# Altium schematic sheet AT-kdFCU.SchDoc
size A4; SheetNumber: 1; SheetTotal: 3
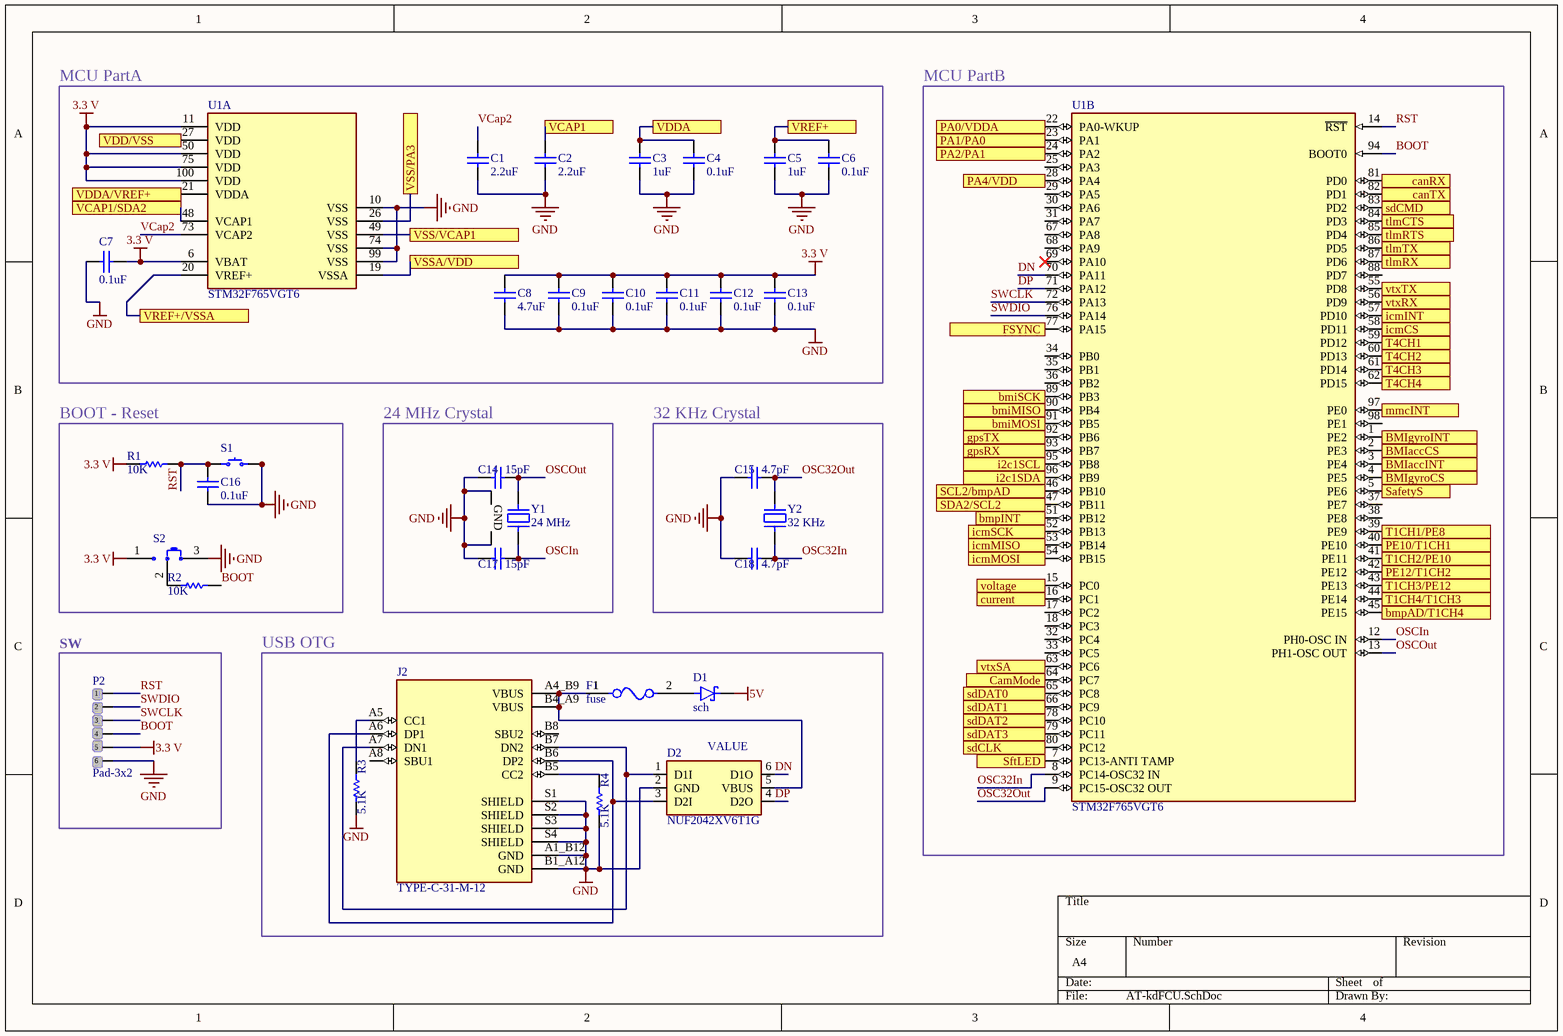
[diagram p0: AT-kdFCU.SchDoc]

## Parts
C1  2.2uF  [Capacitor-0603]
C2  2.2uF  [Capacitor-0603]
C3  1uF  [Capacitor-0603]
C4  0.1uF  [Capacitor-0603]
C5  1uF  [Capacitor-0603]
C6  0.1uF  [Capacitor-0603]
C7  0.1uF  [Capacitor-0603]
C8  4.7uF  [Capacitor-0603]
C9  0.1uF  [Capacitor-0603]
C10  0.1uF  [Capacitor-0603]
C11  0.1uF  [Capacitor-0603]
C12  0.1uF  [Capacitor-0603]
C13  0.1uF  [Capacitor-0603]
C14  15pF  [Capacitor-0603]
C15  4.7pF  [Capacitor-0603]
C16  0.1uF  [Capacitor-0603]
C17  15pF  [Capacitor-0603]
C18  4.7pF  [Capacitor-0603]
D1  sch  [SODFL3619X98N]
D2  NUF2042XV6T1G  [SOT-563]
F1  fuse  [FP-MF-NSMF012-2-MFG]
J2  TYPE-C-31-M-12  [HRO_TYPE-C-31-M-12]
P2  Pad-3x2  [Pad-3x2]
R1  10K  [Resistor-0603]
R2  10K  [Resistor-0603]
R3  5.1K  [Resistor-0603]
R4  5.1K  [Resistor-0603]
S1  PTS810 SJM 250 SMTR LFS  [button]  (value not drawn)
S2  slideSwitch  [switch]  (value not drawn)
U1  STM32F765VGT6  [FP-LQFP100-1L-IPC_B]  (parts A,B of 2)
Y1  24 MHz  [XTAL_TSX-3225_25.0000MF10P-C3]
Y2  32 KHz  [XTAL_ABS07-32.768KHZ-7-T]

## Blocks framed on the sheet
MCU PartA: C1-C13 U1
MCU PartB: U1
BOOT - Reset: C16 R1 R2 S1 S2
24 MHz Crystal: C14 C17 Y1
32 KHz Crystal: C15 C18 Y2
SW: P2
USB OTG: D1 D2 F1 J2 R3 R4

## Ports
BMIaccCS (see AT-kdSENS[1A]), BMIaccINT (see AT-kdSENS[1A]), BMIgyroCS (see AT-kdSENS[1A]), BMIgyroINT (see AT-kdSENS[1A]), bmiMISO (see AT-kdSENS[2B]), bmiMOSI (see AT-kdSENS[1A]), bmiSCK (see AT-kdSENS[1A]), bmpAD/T1CH4 (see AT-kdCONN[2D]), bmpINT (see AT-kdSENS[4A]), CamMode (see AT-kdCONN[2C]), canRX (see AT-kdSENS[1C]), canTX (see AT-kdSENS[1B]), current (see AT-kdCONN[3A]), FSYNC (see AT-kdSENS[1A], AT-kdSENS[2A]), gpsRX (see AT-kdCONN[3C]), gpsTX (see AT-kdCONN[3C]), i2c1SCL (see AT-kdSENS[2C]), i2c1SDA (see AT-kdSENS[2D]), icmCS (see AT-kdSENS[2A]), icmINT (see AT-kdSENS[3A]), icmMISO (see AT-kdSENS[2A]), icmMOSI (see AT-kdSENS[2A]), icmSCK (see AT-kdSENS[2A]), mmcINT (see AT-kdSENS[3C]), PA0/VDDA (see AT-kdCONN[2C]), PA1/PA0 (see AT-kdCONN[2C]), PA2/PA1 (see AT-kdCONN[2C]), PA4/VDD (see AT-kdCONN[2C]), PE10/T1CH1 (see AT-kdCONN[2C]), PE12/T1CH2 (see AT-kdCONN[2D]), SafetyS (see AT-kdSENS[4B]), SCL2/bmpAD (see AT-kdCONN[2D]), SDA2/SCL2 (see AT-kdCONN[2D]), sdCLK (see AT-kdSENS[1D]), sdCMD (see AT-kdSENS[1D]), sdDAT0 (see AT-kdSENS[1D]), sdDAT1 (see AT-kdSENS[1D]), sdDAT2 (see AT-kdSENS[1D]), sdDAT3 (see AT-kdSENS[1D]), SftLED (see AT-kdSENS[4C]), T1CH1/PE8 (see AT-kdCONN[2C]), T1CH2/PE10 (see AT-kdCONN[2C]), T1CH3/PE12 (see AT-kdCONN[2D]), T1CH4/T1CH3 (see AT-kdCONN[2D]), T4CH1 (see AT-kdCONN[1A]), T4CH2 (see AT-kdCONN[1A]), T4CH3 (see AT-kdCONN[1A]), T4CH4 (see AT-kdCONN[1A]), tlmCTS (see AT-kdCONN[3C]), tlmRTS (see AT-kdCONN[3C]), tlmRX (see AT-kdCONN[3C]), tlmTX (see AT-kdCONN[3C]), VCAP1 (see AT-kdCONN[1D]), VCAP1/SDA2 (see AT-kdCONN[2D]), VDD/VSS (see AT-kdCONN[2C]), VDDA (see AT-kdCONN[1C]), VDDA/VREF+ (see AT-kdCONN[2B]), voltage (see AT-kdCONN[3A]), VREF+ (see AT-kdCONN[1C]), VREF+/VSSA (see AT-kdCONN[2B]), VSS/PA3 (see AT-kdCONN[2C]), VSS/VCAP1 (see AT-kdCONN[2D]), VSSA/VDD (see AT-kdCONN[2B]), vtxRX (see AT-kdCONN[4C]), vtxSA (see AT-kdCONN[4C]), vtxTX (see AT-kdCONN[4C])

## Nets
3.3 V: C7.2 C8.2 C9.2 C10.2 C11.2 C12.2 C13.2 P2.5 R1.1 S2.1 U1.6(VBAT) U1.11(VDD) U1.50(VDD) U1.75(VDD) U1.100(VDD)
5V: D1.K
GND: C1.1 C2.1 C3.1 C4.1 C5.1 C6.1 C7.1 C8.1 C9.1 C10.1 C11.1 C12.1 C13.1 C14.2 C15.2 C16.1 C17.2 C18.2 D2.2(GND) J2.A1_B12(GND) J2.B1_A12(GND) J2.S1(SHIELD) J2.S2(SHIELD) J2.S3(SHIELD) J2.S4(SHIELD) P2.6 R3.1 R4.1 S1.3 S1.4 S2.3 U1.10(VSS) U1.74(VSS) U1.99(VSS) Y1.2(GND) Y1.4(GND)
BMIaccCS: U1.2(PE3) ; port BMIaccCS
BMIaccINT: U1.3(PE4) ; port BMIaccINT
BMIgyroCS: U1.4(PE5) ; port BMIgyroCS
BMIgyroINT: U1.1(PE2) ; port BMIgyroINT
bmiMISO: U1.90(PB4) ; port bmiMISO
bmiMOSI: U1.91(PB5) ; port bmiMOSI
bmiSCK: U1.89(PB3) ; port bmiSCK
bmpAD/T1CH4: U1.45(PE15) ; port bmpAD/T1CH4
bmpINT: U1.51(PB12) ; port bmpINT
BOOT: P2.4 R2.2 U1.94(BOOT0)
CamMode: U1.64(PC7) ; port CamMode
canRX: U1.81(PD0) ; port canRX
canTX: U1.82(PD1) ; port canTX
current: U1.16(PC1) ; port current
DN: D2.6(D1O) U1.70(PA11)
DP: D2.4(D2O) U1.71(PA12)
FSYNC: U1.77(PA15) ; port FSYNC
gpsRX: U1.93(PB7) ; port gpsRX
gpsTX: U1.92(PB6) ; port gpsTX
i2c1SCL: U1.95(PB8) ; port i2c1SCL
i2c1SDA: U1.96(PB9) ; port i2c1SDA
icmCS: U1.58(PD11) ; port icmCS
icmINT: U1.57(PD10) ; port icmINT
icmMISO: U1.53(PB14) ; port icmMISO
icmMOSI: U1.54(PB15) ; port icmMOSI
icmSCK: U1.52(PB13) ; port icmSCK
mmcINT: U1.97(PE0) ; port mmcINT
OSC32In: C18.1 U1.8(PC14-OSC32_IN) Y2.1
OSC32Out: C15.1 U1.9(PC15-OSC32_OUT) Y2.2
OSCIn: C17.1 U1.12(PH0-OSC_IN) Y1.3
OSCOut: C14.1 U1.13(PH1-OSC_OUT) Y1.1
PA0/VDDA: U1.22(PA0-WKUP) ; port PA0/VDDA
PA1/PA0: U1.23(PA1) ; port PA1/PA0
PA2/PA1: U1.24(PA2) ; port PA2/PA1
PA4/VDD: U1.28(PA4) ; port PA4/VDD
PE10/T1CH1: U1.40(PE10) ; port PE10/T1CH1
PE12/T1CH2: U1.42(PE12) ; port PE12/T1CH2
RST: C16.2 P2.1 R1.2 S1.1 S1.2 U1.14(~{RST})
SafetyS: U1.5(PE6) ; port SafetyS
SCL2/bmpAD: U1.46(PB10) ; port SCL2/bmpAD
SDA2/SCL2: U1.47(PB11) ; port SDA2/SCL2
sdCLK: U1.80(PC12) ; port sdCLK
sdCMD: U1.83(PD2) ; port sdCMD
sdDAT0: U1.65(PC8) ; port sdDAT0
sdDAT1: U1.66(PC9) ; port sdDAT1
sdDAT2: U1.78(PC10) ; port sdDAT2
sdDAT3: U1.79(PC11) ; port sdDAT3
SftLED: U1.7(PC13-ANTI_TAMP) ; port SftLED
SWCLK: P2.3 U1.72(PA13)
SWDIO: P2.2 U1.76(PA14)
T1CH1/PE8: U1.39(PE9) ; port T1CH1/PE8
T1CH2/PE10: U1.41(PE11) ; port T1CH2/PE10
T1CH3/PE12: U1.43(PE13) ; port T1CH3/PE12
T1CH4/T1CH3: U1.44(PE14) ; port T1CH4/T1CH3
T4CH1: U1.59(PD12) ; port T4CH1
T4CH2: U1.60(PD13) ; port T4CH2
T4CH3: U1.61(PD14) ; port T4CH3
T4CH4: U1.62(PD15) ; port T4CH4
tlmCTS: U1.84(PD3) ; port tlmCTS
tlmRTS: U1.85(PD4) ; port tlmRTS
tlmRX: U1.87(PD6) ; port tlmRX
tlmTX: U1.86(PD5) ; port tlmTX
VCAP1: C2.2 ; port VCAP1
VCAP1/SDA2: U1.48(VCAP1) ; port VCAP1/SDA2
VCap2: C1.2 U1.73(VCAP2)
VDD/VSS: U1.27(VDD) ; port VDD/VSS
VDDA: C3.2 C4.2 ; port VDDA
VDDA/VREF+: U1.21(VDDA) ; port VDDA/VREF+
voltage: U1.15(PC0) ; port voltage
VREF+: C5.2 C6.2 ; port VREF+
VREF+/VSSA: U1.20(VREF+) ; port VREF+/VSSA
VSS/PA3: U1.26(VSS) ; port VSS/PA3
VSS/VCAP1: U1.49(VSS) ; port VSS/VCAP1
VSSA/VDD: U1.19(VSSA) ; port VSSA/VDD
vtxRX: U1.56(PD9) ; port vtxRX
vtxSA: U1.63(PC6) ; port vtxSA
vtxTX: U1.55(PD8) ; port vtxTX
NetD1_A: D1.A F1.2
NetD2_1: D2.1(D1I) J2.A7(DN1) J2.B7(DN2)
NetD2_3: D2.3(D2I) J2.A6(DP1) J2.B6(DP2)
NetD2_5: D2.5(VBUS) F1.1 J2.A4_B9(VBUS) J2.B4_A9(VBUS)
NetJ2_A5: J2.A5(CC1) R3.2
NetJ2_B5: J2.B5(CC2) R4.2
NetR2_1: R2.1 S2.2(COM)

Not connected (* = marked no-connect by the designer): J2 A8(SBU1) B8(SBU2); U1 17(PC2) 18(PC3) 25(PA3) 29(PA5) 30(PA6) 31(PA7) 32(PC4) 33(PC5) 34(PB0) 35(PB1) 36(PB2) 37(PE7) 38(PE8) 67(PA8) 68(PA9) 69(PA10)* 88(PD7) 98(PE1)

## Notes on the sheet
- (in symbol NUF2042XV6T1G) VALUE

## Library data of the parts
C1-C18 = 0603-Cap
D1 = MBR230LSFT1G: DIODE SCHOTTKY 30V 2A SOD123 MBR230LSTR; MF: ON Semiconductor; SnapEDA_Link: https://www.snapeda.com/parts/MBR230LSFT1G/Onsemi/view-part/?ref=snap; Package: SOD-123FL-2 ON Semiconductor; Value: *; MP: MBR230LSFT1G; Check_prices: https://www.snapeda.com/parts/MBR230LSFT1G/Onsemi/view-part/?ref=eda
D2 = NUF2042XV6T1G: RC (Pi) EMI Filter 2nd Order Low Pass 2 Channel R = 22Ohms, C = 42pF (Total) SOT-563, SOT-666; MF: onsemi; SnapEDA_Link: https://www.snapeda.com/parts/NUF2042XV6T1G/Onsemi/view-part/?ref=snap; Package: SOT-563-6 ON Semiconductor; MP: NUF2042XV6T1G; Check_prices: https://www.snapeda.com/parts/NUF2042XV6T1G/Onsemi/view-part/?ref=eda
F1 = CMP-07400-000025-1: PTC RESET FUSE 30V 120MA 1206; Manufacturer Part Number: MF-NSMF012-2; Manufacturer: Bourns Inc.; Hold Current: 0.12A; Trip Time: 0.2s; Trip Current: 0.29A; Automotive Grade: Grade 3; Resistance: 1.35-8.5Ω; Current Rating: 10A; Value: 1.35-8.5Ω; Category: Fuse; Device Class L2: PTC Resettable Fuses; ComponentLink2URL: https://www.bourns.com/docs/Product-Datasheets/mfnsmf.pdf; Package: MF-NSMF012-2; Automotive: Yes; Temperature Range Low: -40°C; Lead Free: Yes; Voltage Rating: 30V; Digikey Description: PTC RESET FUSE 30V 120MA 1206; Ambient Temperature Range Low: -40°C; Ambient Temperature Range High: +85°C; RoHS: TRUE; Device Class L3: unset; Device Class L1: Circuit Protection; Mouser Description: Resettable Fuses - PPTC 0.12A 30V 1.35ohm; Octopart: https://octopart.com/mf-nsmf012-2-bourns-24569; Temperature Range High: +85°C; ComponentLink2Description: Datasheet; Height: 1.1mm; Temperature: -40°C to +85°C
J2 = TYPE-C-31-M-12: USB Connectors 24 Receptacle 1 8.94*7.3mm RoHS; MF: HRO Electronics Co., Ltd.; Price: None; Value: *; SnapEDA_Link: https://www.snapeda.com/parts/TYPE-C-31-M-12/HRO+Electronics+Co.%252C+Ltd./view-part/?ref=snap; Package: Package; Availability: Not in stock; Check_prices: https://www.snapeda.com/parts/TYPE-C-31-M-12/HRO+Electronics+Co.%252C+Ltd./view-part/?ref=eda; MP: TYPE-C-31-M-12
R1-R4 = 0603-Res
S1 = PTS810 SJM 250 SMTR LFS: SWITCH TACTILE SPST-NO 0.05A 16V; Manufacturer: C&K; Actuator Height off PCB, Vertical: 2.50mm; Actuator Orientation: Top Actuated; Actuator Type: Oval Button; Contact Rating @ Voltage: 0.05A @ 16VDC; Illumination: Non-Illuminated; Operating Force: 160gf; Outline: 4.20mm x 3.20mm; Switch Function: Off-Mom; Part Number: PTS810 SJM 250 SMTR LFS; Circuit: SPST-NO; ComponentLink1Description: Datasheet; ComponentLink1URL: https://dznh3ojzb2azq.cloudfront.net/products/Tactile/PTS810/documents/datasheet.pdf; ComponentLink2Description: DigiKey Link; ComponentLink2URL: http://digikey.com/product-detail/en/c-k/PTS810-SJM-250-SMTR-LFS/CKN10502CT-ND/4176673; LastUpdated: 9/04/2020 10:00:13; Lifecycle Status: Active; Minimum Order: 1; Mounting Type: Surface Mount; Operating Temperature: -40°C ~ 85°C; Packaging: TapeAndReel; Part Status: Active; Price: 0.16; Series: PTS810; Supplier 1: DigiKey; Supplier Part Number 1: CKN10502CT-ND; Termination Style: J Lead
S2 = SS312SAH4-R: SWITCH SLIDE SPDT 0.4VA 28V; Part Number: SS312SAH4-R
U1 = CMP-12105-000145-1: IC MCU 32BIT 1MB FLASH 100LQFP; Peripherals: Brown-out Detect/Reset; Number of I/Os: 82; Interface: I2C; Oscillator Type: Internal; Frequency: 216MHz; Core Architecture: ARM; Memory Size: 1MB; Min Operating Temperature: -40°C; Packaging: Tray; Memory Type: FLASH; Max Operating Temperature: 85°C; Case/Package: LQFP; RoHS Compliant: Yes
Y1 = TSX-3225 24.0000MF15X-AC6: CRYSTAL 24.0000MHZ 9PF SMD; Manufacturer: EPSON; ESR (Equivalent Series Resistance): 40 Ohms; Frequency Stability: ±15ppm; Frequency Tolerance: ±10ppm; Operating Mode: Fundamental; Part Number: TSX-3225 24.0000MF15X-AC6; ComponentLink1Description: Datasheet; ComponentLink1URL: https://support.epson.biz/td/api/doc_check.php?dl=brief_TSX-3225&lang=en; ComponentLink2Description: DigiKey Link; ComponentLink2URL: https://www.digikey.com/en/products/detail/epson/TSX-3225-24-0000MF15X-AC6/5261221; Frequency: 24 MHz; Height - Seated (Max): 0.024" (0.60mm); LastUpdated: 3.06.2024 20:02:15; Lifecycle Status: Active; Load Capacitance: 9pF; Minimum Order: 1; Mounting Type: Surface Mount; Operating Temperature: -40°C ~ 85°C; Package / Case: 4-SMD, No Lead; Packaging: TapeAndReel; PartId: 432; Part Status: Active; Price: 0.20; Series: TSX-3225; Size / Dimension: 0.126" L x 0.098" W (3.20mm x 2.50mm); Supplier 1: DigiKey; Supplier Part Number 1: SER4180CT-ND; Type: MHz Crystal; Value: 24 MHz
Y2 = ABS07-32.768KHZ-7-T: CRYSTAL 32.7680KHZ 7PF SMD; Part Number: ABS07-32.768KHZ-7-T